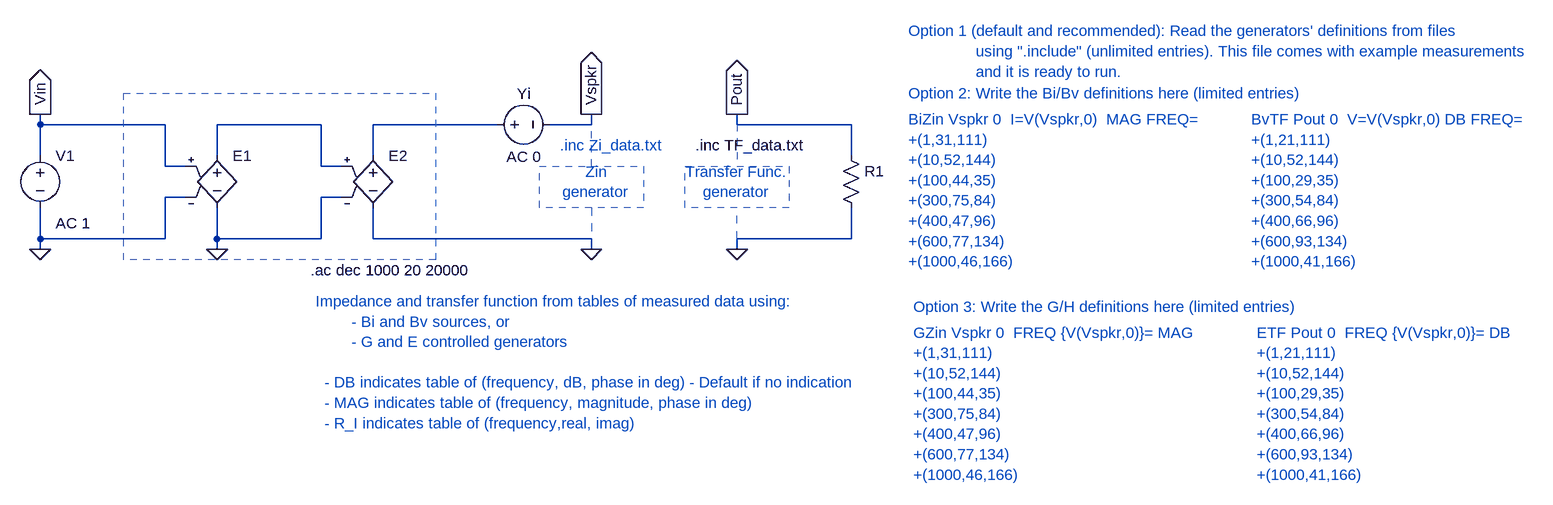
[diagram p0: schematic Loudspeaker_with_measurement_files_and_digital_filter.asc]
Loudspeaker_with_measurement_files_and_digital_filter.asc, the LTspice schematic file:
Version 4
SHEET 1 52524 976
WIRE -336 80 -336 64
WIRE -144 80 -336 80
WIRE 96 80 -64 80
WIRE 368 80 176 80
WIRE 512 80 512 64
WIRE 512 80 448 80
WIRE 736 80 736 64
WIRE 912 80 736 80
WIRE -336 128 -336 80
WIRE -64 128 -64 80
WIRE 176 128 176 80
WIRE 912 128 912 80
WIRE -144 144 -144 80
WIRE -112 144 -144 144
WIRE 96 144 96 80
WIRE 128 144 96 144
WIRE -112 192 -144 192
WIRE 128 192 96 192
WIRE -336 256 -336 208
WIRE -144 256 -144 192
WIRE -144 256 -336 256
WIRE -64 256 -64 208
WIRE 96 256 96 192
WIRE 96 256 -64 256
WIRE 176 256 176 208
WIRE 512 256 176 256
WIRE 912 256 912 208
WIRE 912 256 736 256
WIRE -336 272 -336 256
WIRE -64 272 -64 256
WIRE 512 272 512 256
WIRE 736 272 736 256
FLAG 512 272 0
FLAG -336 64 Vin
IOPIN -336 64 Out
FLAG 736 272 0
FLAG 512 64 Vspkr
IOPIN 512 64 Out
FLAG 736 64 Pout
IOPIN 736 64 Out
FLAG -336 272 0
FLAG -64 272 0
SYMBOL voltage -336 112 R0
WINDOW 123 24 120 Left 2
WINDOW 39 0 0 Left 2
SYMATTR Value2 AC 1
SYMATTR InstName V1
SYMATTR Value ""
SYMBOL res 896 112 R0
WINDOW 3 36 76 Invisible 2
SYMATTR Value 1k
SYMATTR InstName R1
SYMBOL voltage 352 80 R270
WINDOW 0 32 56 VTop 2
WINDOW 3 -32 56 VBottom 2
WINDOW 123 -34 56 VBottom 2
WINDOW 39 0 0 Left 2
SYMATTR InstName Yi
SYMATTR Value ""
SYMATTR Value2 AC 0
SYMBOL e 176 112 R0
WINDOW 3 24 96 Invisible 2
SYMATTR Value Laplace=(0.987369391314584+-1.97473878262917*exp(-s*1.04166666666667e-05)+0.987369391314584*exp(-2*s*1.04166666666667e-05))/(1+-1.97420999113081*exp(-s*1.04166666666667e-05)+0.975267574127527*exp(-2*s*1.04166666666667e-05))
SYMATTR InstName E2
SYMBOL e -64 112 R0
WINDOW 3 16 122 Invisible 2
SYMATTR Value Laplace=(0.970398608200472+-1.94079721640094*exp(-s*1.04166666666667e-05)+0.970398608200472*exp(-2*s*1.04166666666667e-05))/(1+-1.94027751370553*exp(-s*1.04166666666667e-05)+0.941316919096359*exp(-2*s*1.04166666666667e-05))
SYMATTR InstName E1
TEXT 80 304 Left 2 !.ac dec 1000 20 20000
TEXT 88 352 Left 2 ;Impedance and transfer function from tables of measured data using:\n        - Bi and Bv sources, or \n        - G and E controlled generators\n \n  - DB indicates table of (frequency, dB, phase in deg) - Default if no indication\n  - MAG indicates table of (frequency, magnitude, phase in deg)\n  - R_I indicates table of (frequency,real, imag)
TEXT 1000 72 Left 2 ;BiZin Vspkr 0  I=V(Vspkr,0)  MAG FREQ= \n+(1,31,111)\n+(10,52,144)\n+(100,44,35)\n+(300,75,84)\n+(400,47,96)\n+(600,77,134)\n+(1000,46,166)
TEXT 1528 72 Left 2 ;BvTF Pout 0  V=V(Vspkr,0) DB FREQ=  \n+(1,21,111)\n+(10,52,144)\n+(100,29,35)\n+(300,54,84)\n+(400,66,96)\n+(600,93,134)\n+(1000,41,166)
TEXT 1008 400 Left 2 ;GZin Vspkr 0  FREQ {V(Vspkr,0)}= MAG\n+(1,31,111)\n+(10,52,144)\n+(100,44,35)\n+(300,75,84)\n+(400,47,96)\n+(600,77,134)\n+(1000,46,166)
TEXT 1536 400 Left 2 ;ETF Pout 0  FREQ {V(Vspkr,0)}= DB\n+(1,21,111)\n+(10,52,144)\n+(100,29,35)\n+(300,54,84)\n+(400,66,96)\n+(600,93,134)\n+(1000,41,166)
TEXT 464 112 Left 2 ;.inc Zi_data.txt
TEXT 672 112 Left 2 !.inc TF_data.txt
TEXT 1000 -64 Left 2 ;Option 1 (default and recommended): Read the generators' definitions from files\n               using ".include" (unlimited entries). This file comes with example measurements\n               and it is ready to run.
TEXT 1000 32 Left 2 ;Option 2: Write the Bi/Bv definitions here (limited entries)
TEXT 1008 360 Left 2 ;Option 3: Write the G/H definitions here (limited entries)
TEXT 520 168 Center 2 ;Zin\ngenerator
TEXT 736 168 Center 2 ;Transfer Func.\ngenerator
LINE Normal 736 80 736 144 2
LINE Normal 736 256 736 208 2
LINE Normal 512 208 512 256 2
LINE Normal 512 144 512 80 2
RECTANGLE Normal 816 208 656 144 2
RECTANGLE Normal 592 208 432 144 2
RECTANGLE Normal 272 288 -208 32 2

The netlist it stands for:
* Loudspeaker_with_measurement_files_and_digital_filter.asc
V1 Vin 0 AC 1
R1 Pout 0 1k
V§Yi N002 Vspkr AC 0
E2 N002 0 N001 0 Laplace=(0.987369391314584+-1.97473878262917*exp(-s*1.04166666666667e-05)+0.987369391314584*exp(-2*s*1.04166666666667e-05))/(1+-1.97420999113081*exp(-s*1.04166666666667e-05)+0.975267574127527*exp(-2*s*1.04166666666667e-05))
E1 N001 0 Vin 0 Laplace=(0.970398608200472+-1.94079721640094*exp(-s*1.04166666666667e-05)+0.970398608200472*exp(-2*s*1.04166666666667e-05))/(1+-1.94027751370553*exp(-s*1.04166666666667e-05)+0.941316919096359*exp(-2*s*1.04166666666667e-05))
.ac dec 1000 20 20000
* Impedance and transfer function from tables of measured data using:
*         - Bi and Bv sources, or
*         - G and E controlled generators
*   - DB indicates table of (frequency, dB, phase in deg) - Default if no indication
*   - MAG indicates table of (frequency, magnitude, phase in deg)
*   - R_I indicates table of (frequency,real, imag)
* BiZin Vspkr 0  I=V(Vspkr,0)  MAG FREQ=
* +(1,31,111)
* +(10,52,144)
* +(100,44,35)
* +(300,75,84)
* +(400,47,96)
* +(600,77,134)
* +(1000,46,166)
* BvTF Pout 0  V=V(Vspkr,0) DB FREQ=
* +(1,21,111)
* +(10,52,144)
* +(100,29,35)
* +(300,54,84)
* +(400,66,96)
* +(600,93,134)
* +(1000,41,166)
* GZin Vspkr 0  FREQ {V(Vspkr,0)}= MAG
* +(1,31,111)
* +(10,52,144)
* +(100,44,35)
* +(300,75,84)
* +(400,47,96)
* +(600,77,134)
* +(1000,46,166)
* ETF Pout 0  FREQ {V(Vspkr,0)}= DB
* +(1,21,111)
* +(10,52,144)
* +(100,29,35)
* +(300,54,84)
* +(400,66,96)
* +(600,93,134)
* +(1000,41,166)
* .inc Zi_data.txt
.inc TF_data.txt
* Option 1 (default and recommended): Read the generators' definitions from files
*                using ".include" (unlimited entries). This file comes with example measurements
*                and it is ready to run.
* Option 2: Write the Bi/Bv definitions here (limited entries)
* Option 3: Write the G/H definitions here (limited entries)
* Zin
* generator
* Transfer Func.
* generator
.backanno
.end